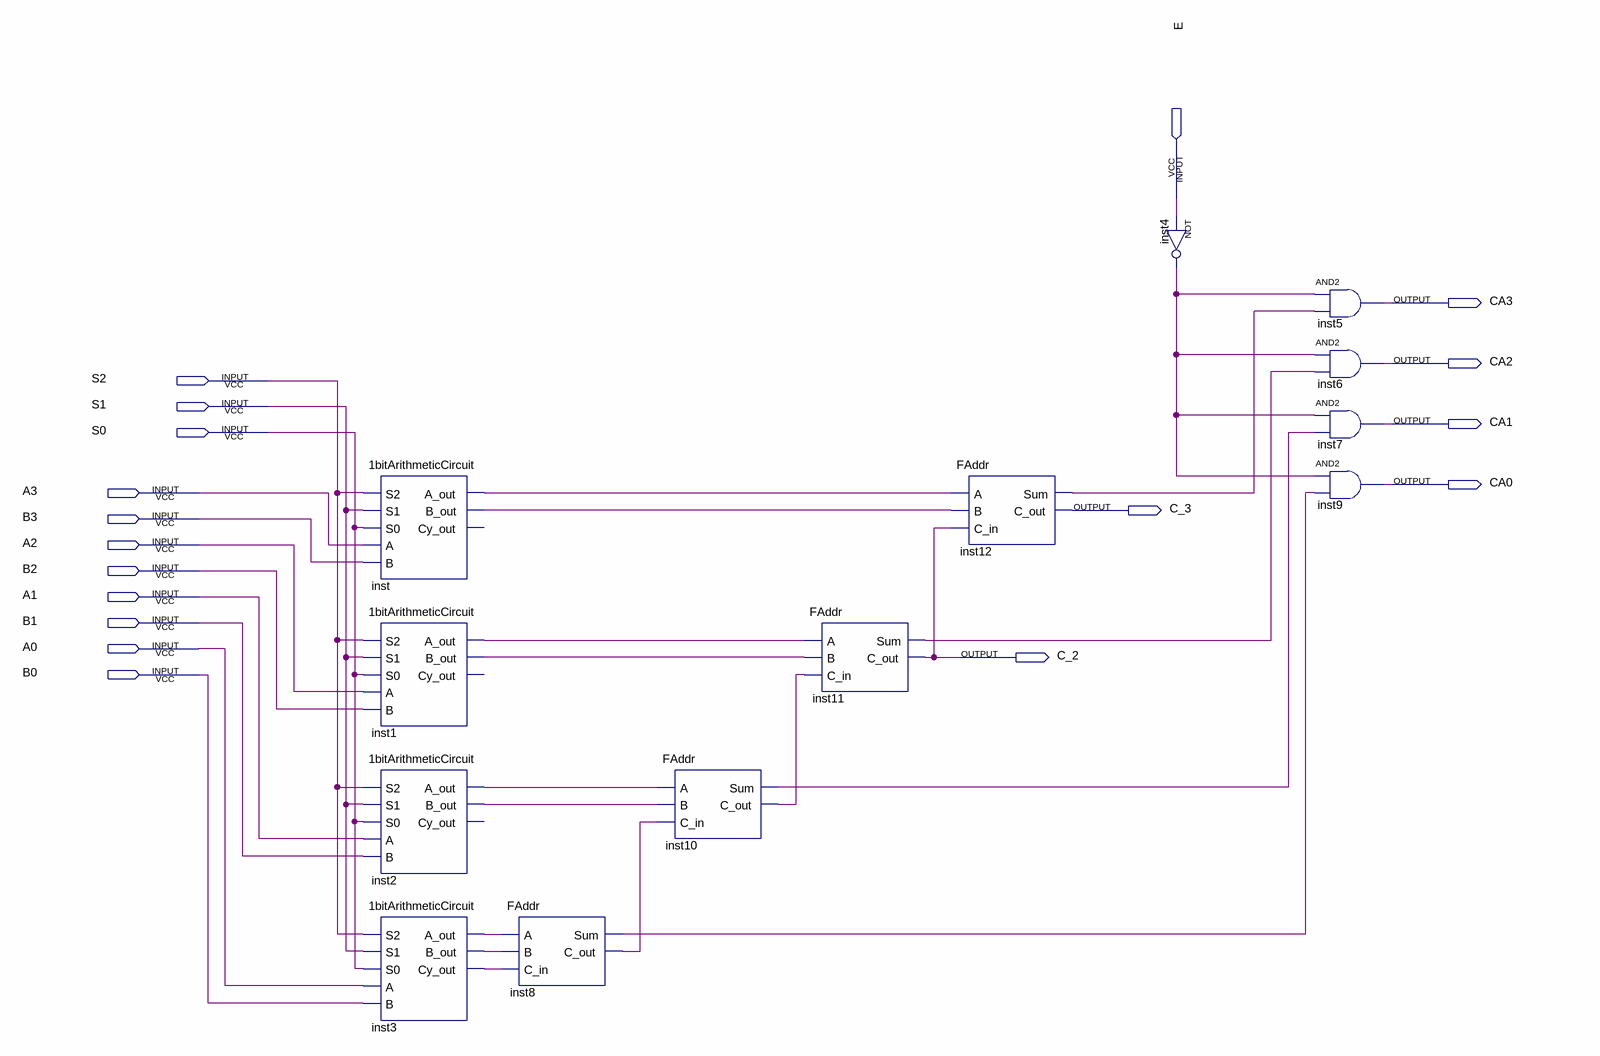
[diagram p0: schematic sheet]
// Quartus schematic 4bitArithmeticCircuit.bdf as structural Verilog: 13 symbols, 18 pins
module \4bitArithmeticCircuit  (
  input  E,
  input  S2,
  input  S1,
  input  S0,
  input  A3,
  input  B3,
  input  A2,
  input  B2,
  input  A1,
  input  B1,
  input  A0,
  input  B0,
  output CA3,
  output CA2,
  output CA1,
  output CA0,
  output C_3,
  output C_2
);

  wire inst1_a_out, inst1_b_out, inst2_a_out, inst2_b_out, inst3_a_out, inst3_b_out, inst3_cy_out, inst4_out,
       inst8_c_out, inst8_sum, inst10_c_out, inst10_sum, inst11_sum, inst12_sum, inst_a_out, inst_b_out;

  \1bitArithmeticCircuit  inst (
    .S2(S2), .S1(S1), .S0(S0), .A(A3), .B(B3), .A_out(inst_a_out), .B_out(inst_b_out));  // open: Cy_out
  \1bitArithmeticCircuit  inst1 (
    .S2(S2), .S1(S1), .S0(S0), .A(A2), .B(B2), .A_out(inst1_a_out), .B_out(inst1_b_out));  // open: Cy_out
  \1bitArithmeticCircuit  inst2 (
    .S2(S2), .S1(S1), .S0(S0), .A(A1), .B(B1), .A_out(inst2_a_out), .B_out(inst2_b_out));  // open: Cy_out
  \1bitArithmeticCircuit  inst3 (
    .S2(S2), .S1(S1), .S0(S0), .A(A0), .B(B0), .A_out(inst3_a_out), .B_out(inst3_b_out), .Cy_out(inst3_cy_out));
  FAddr inst8 (.A(inst3_a_out), .B(inst3_b_out), .C_in(inst3_cy_out), .Sum(inst8_sum), .C_out(inst8_c_out));
  FAddr inst10 (.A(inst2_a_out), .B(inst2_b_out), .C_in(inst8_c_out), .Sum(inst10_sum), .C_out(inst10_c_out));
  FAddr inst11 (.A(inst1_a_out), .B(inst1_b_out), .C_in(inst10_c_out), .Sum(inst11_sum), .C_out(C_2));
  FAddr inst12 (.A(inst_a_out), .B(inst_b_out), .C_in(C_2), .Sum(inst12_sum), .C_out(C_3));
  not inst4 (inst4_out, E);
  and inst5 (CA3, inst4_out, inst12_sum);
  and inst6 (CA2, inst4_out, inst11_sum);
  and inst7 (CA1, inst4_out, inst10_sum);
  and inst9 (CA0, inst4_out, inst8_sum);
endmodule
